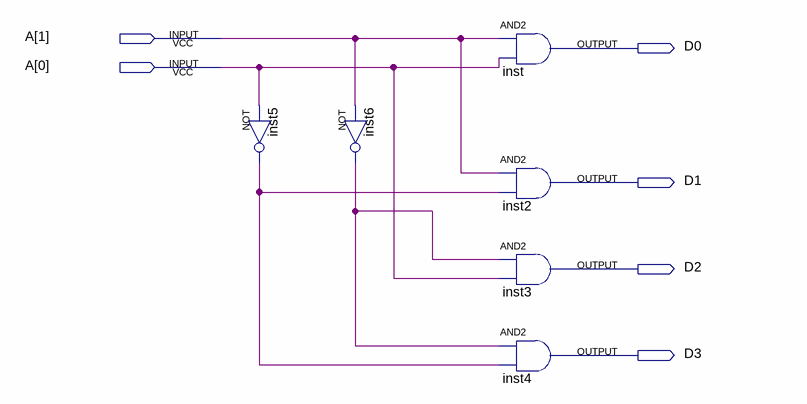
[diagram p0: schematic sheet]
// Quartus schematic DECODER24.bdf as structural Verilog: 6 symbols, 6 pins
module DECODER24 (
  input  [1:0] A,
  output D0,
  output D1,
  output D2,
  output D3
);

  wire inst5_out, inst6_out;

  not inst5 (inst5_out, A[0]);
  not inst6 (inst6_out, A[1]);
  and inst (D0, A[1], A[0]);
  and inst2 (D1, A[1], inst5_out);
  and inst3 (D2, inst6_out, A[0]);
  and inst4 (D3, inst6_out, inst5_out);
endmodule
